# EasyEDA Pro project bliysfyt-night-light-af2cf507.epro, board PCB1
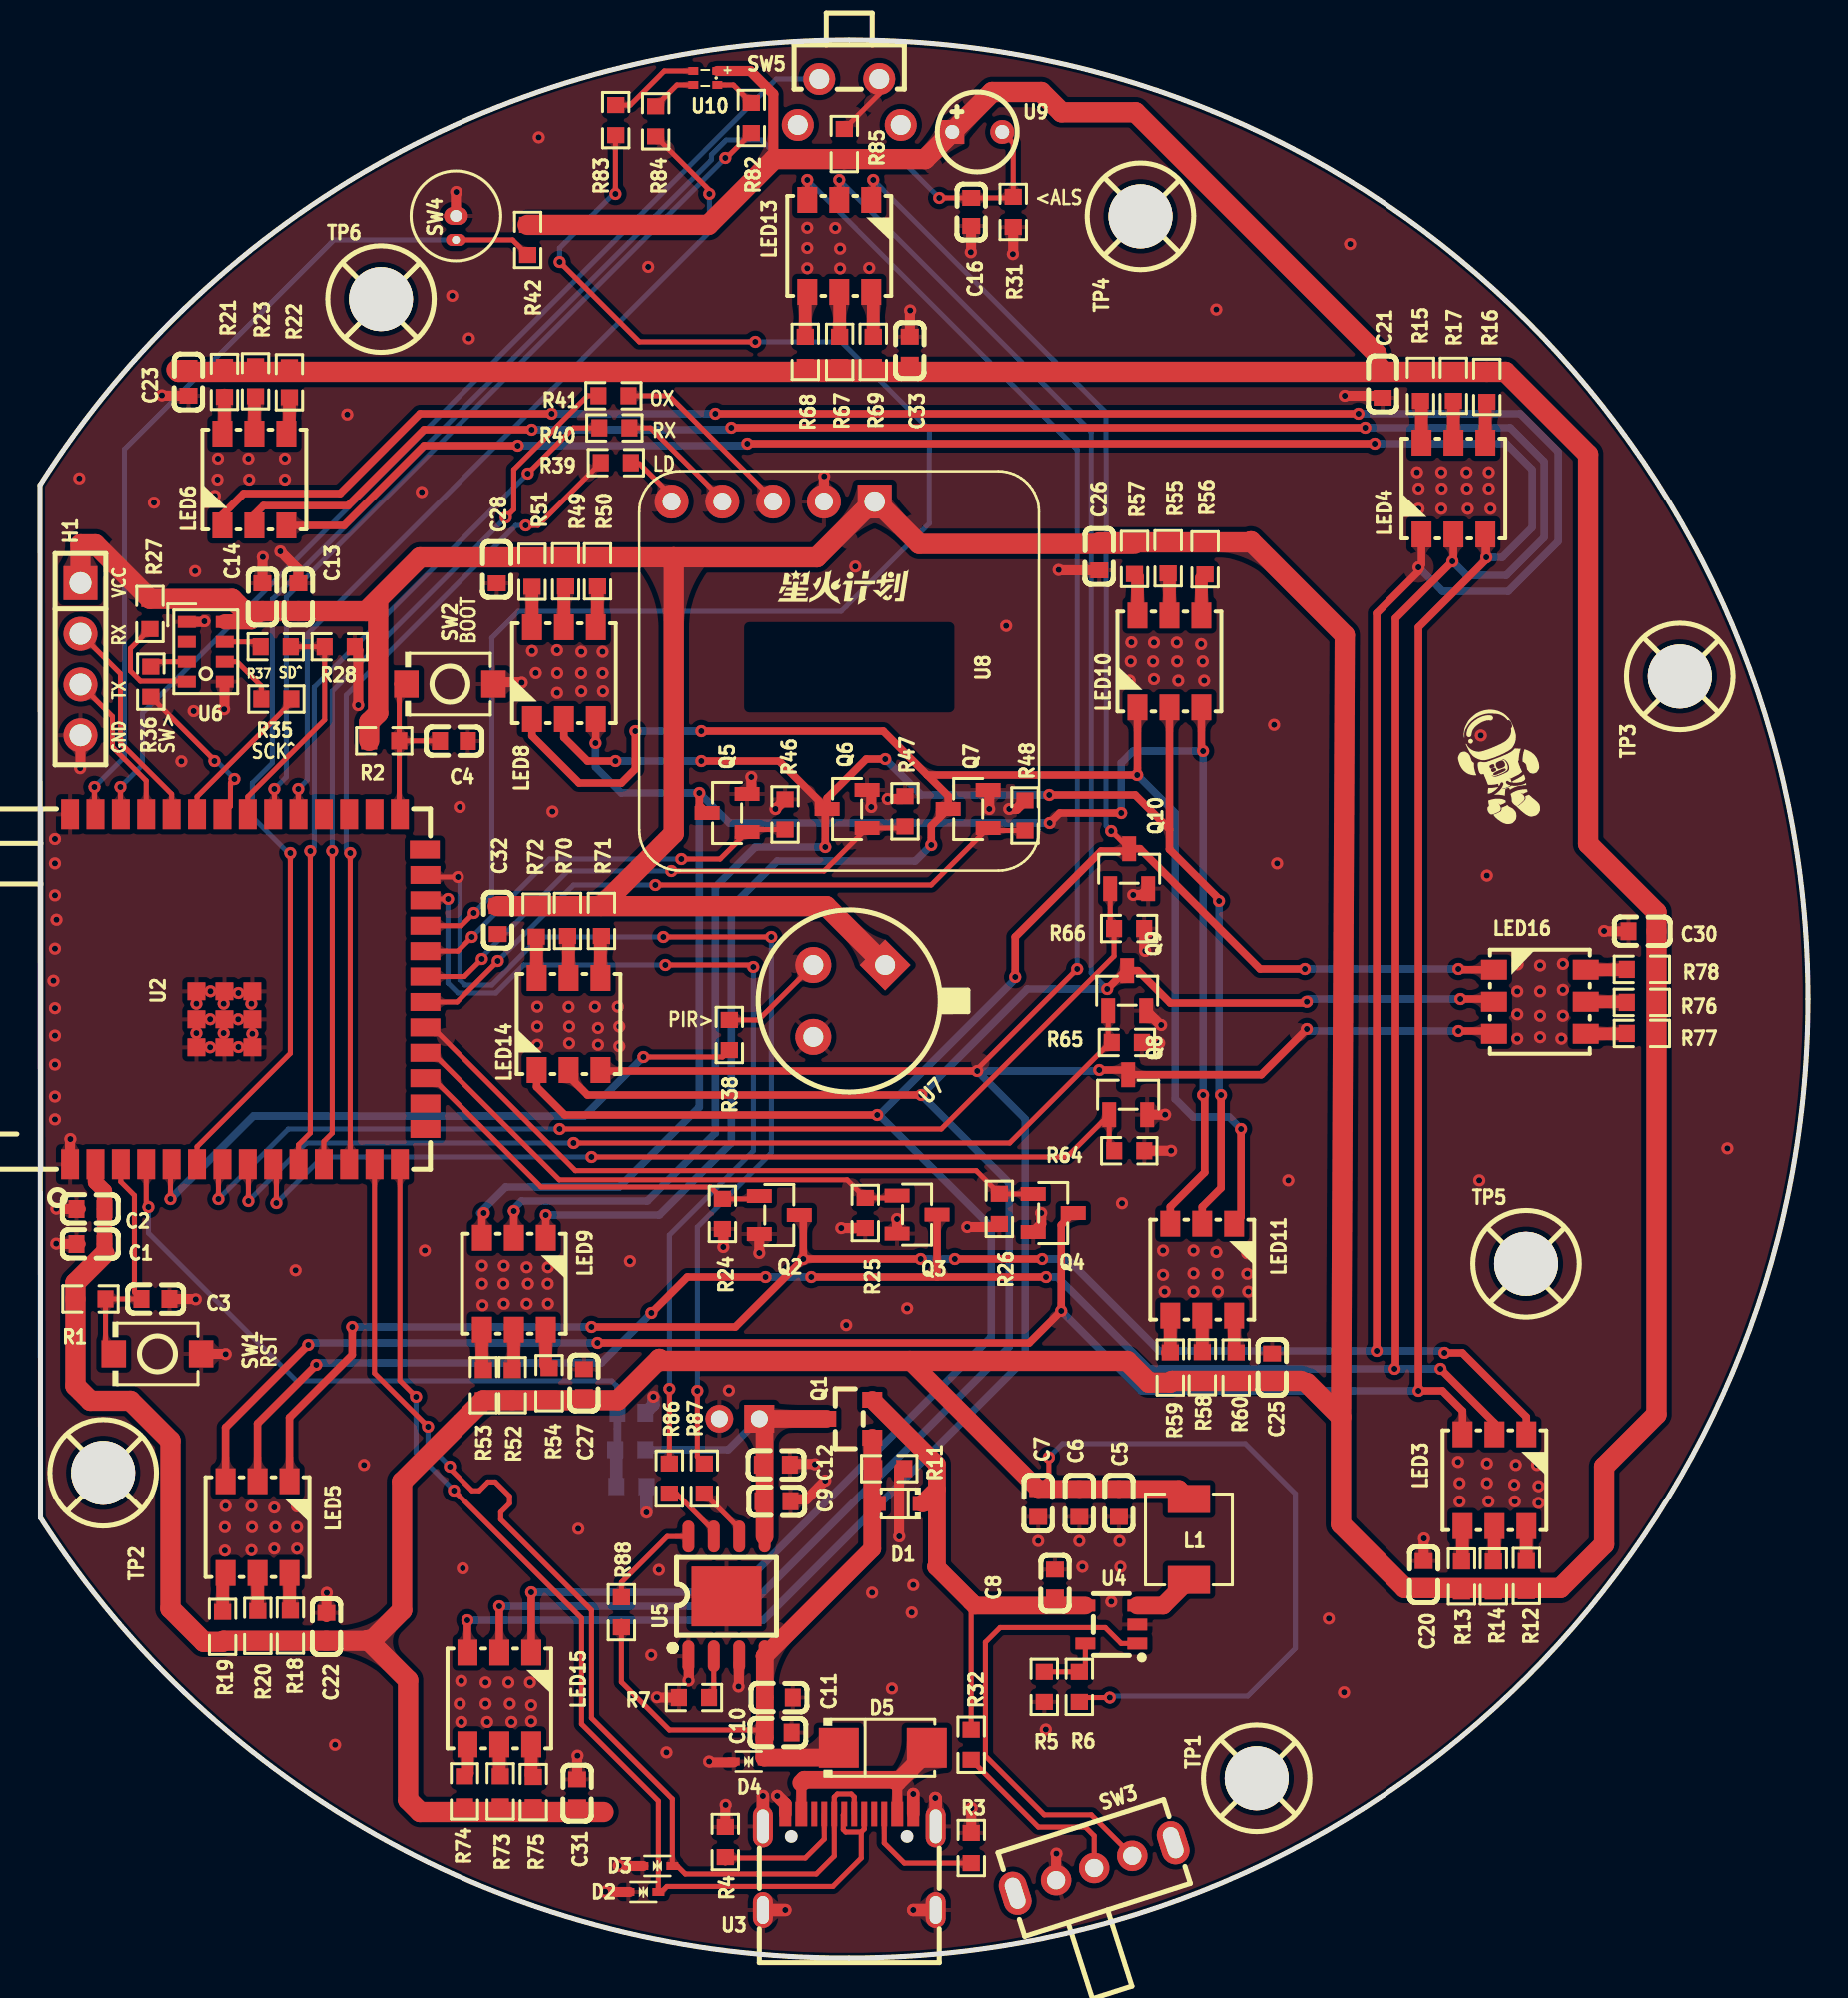
[diagram p3: board, top side]
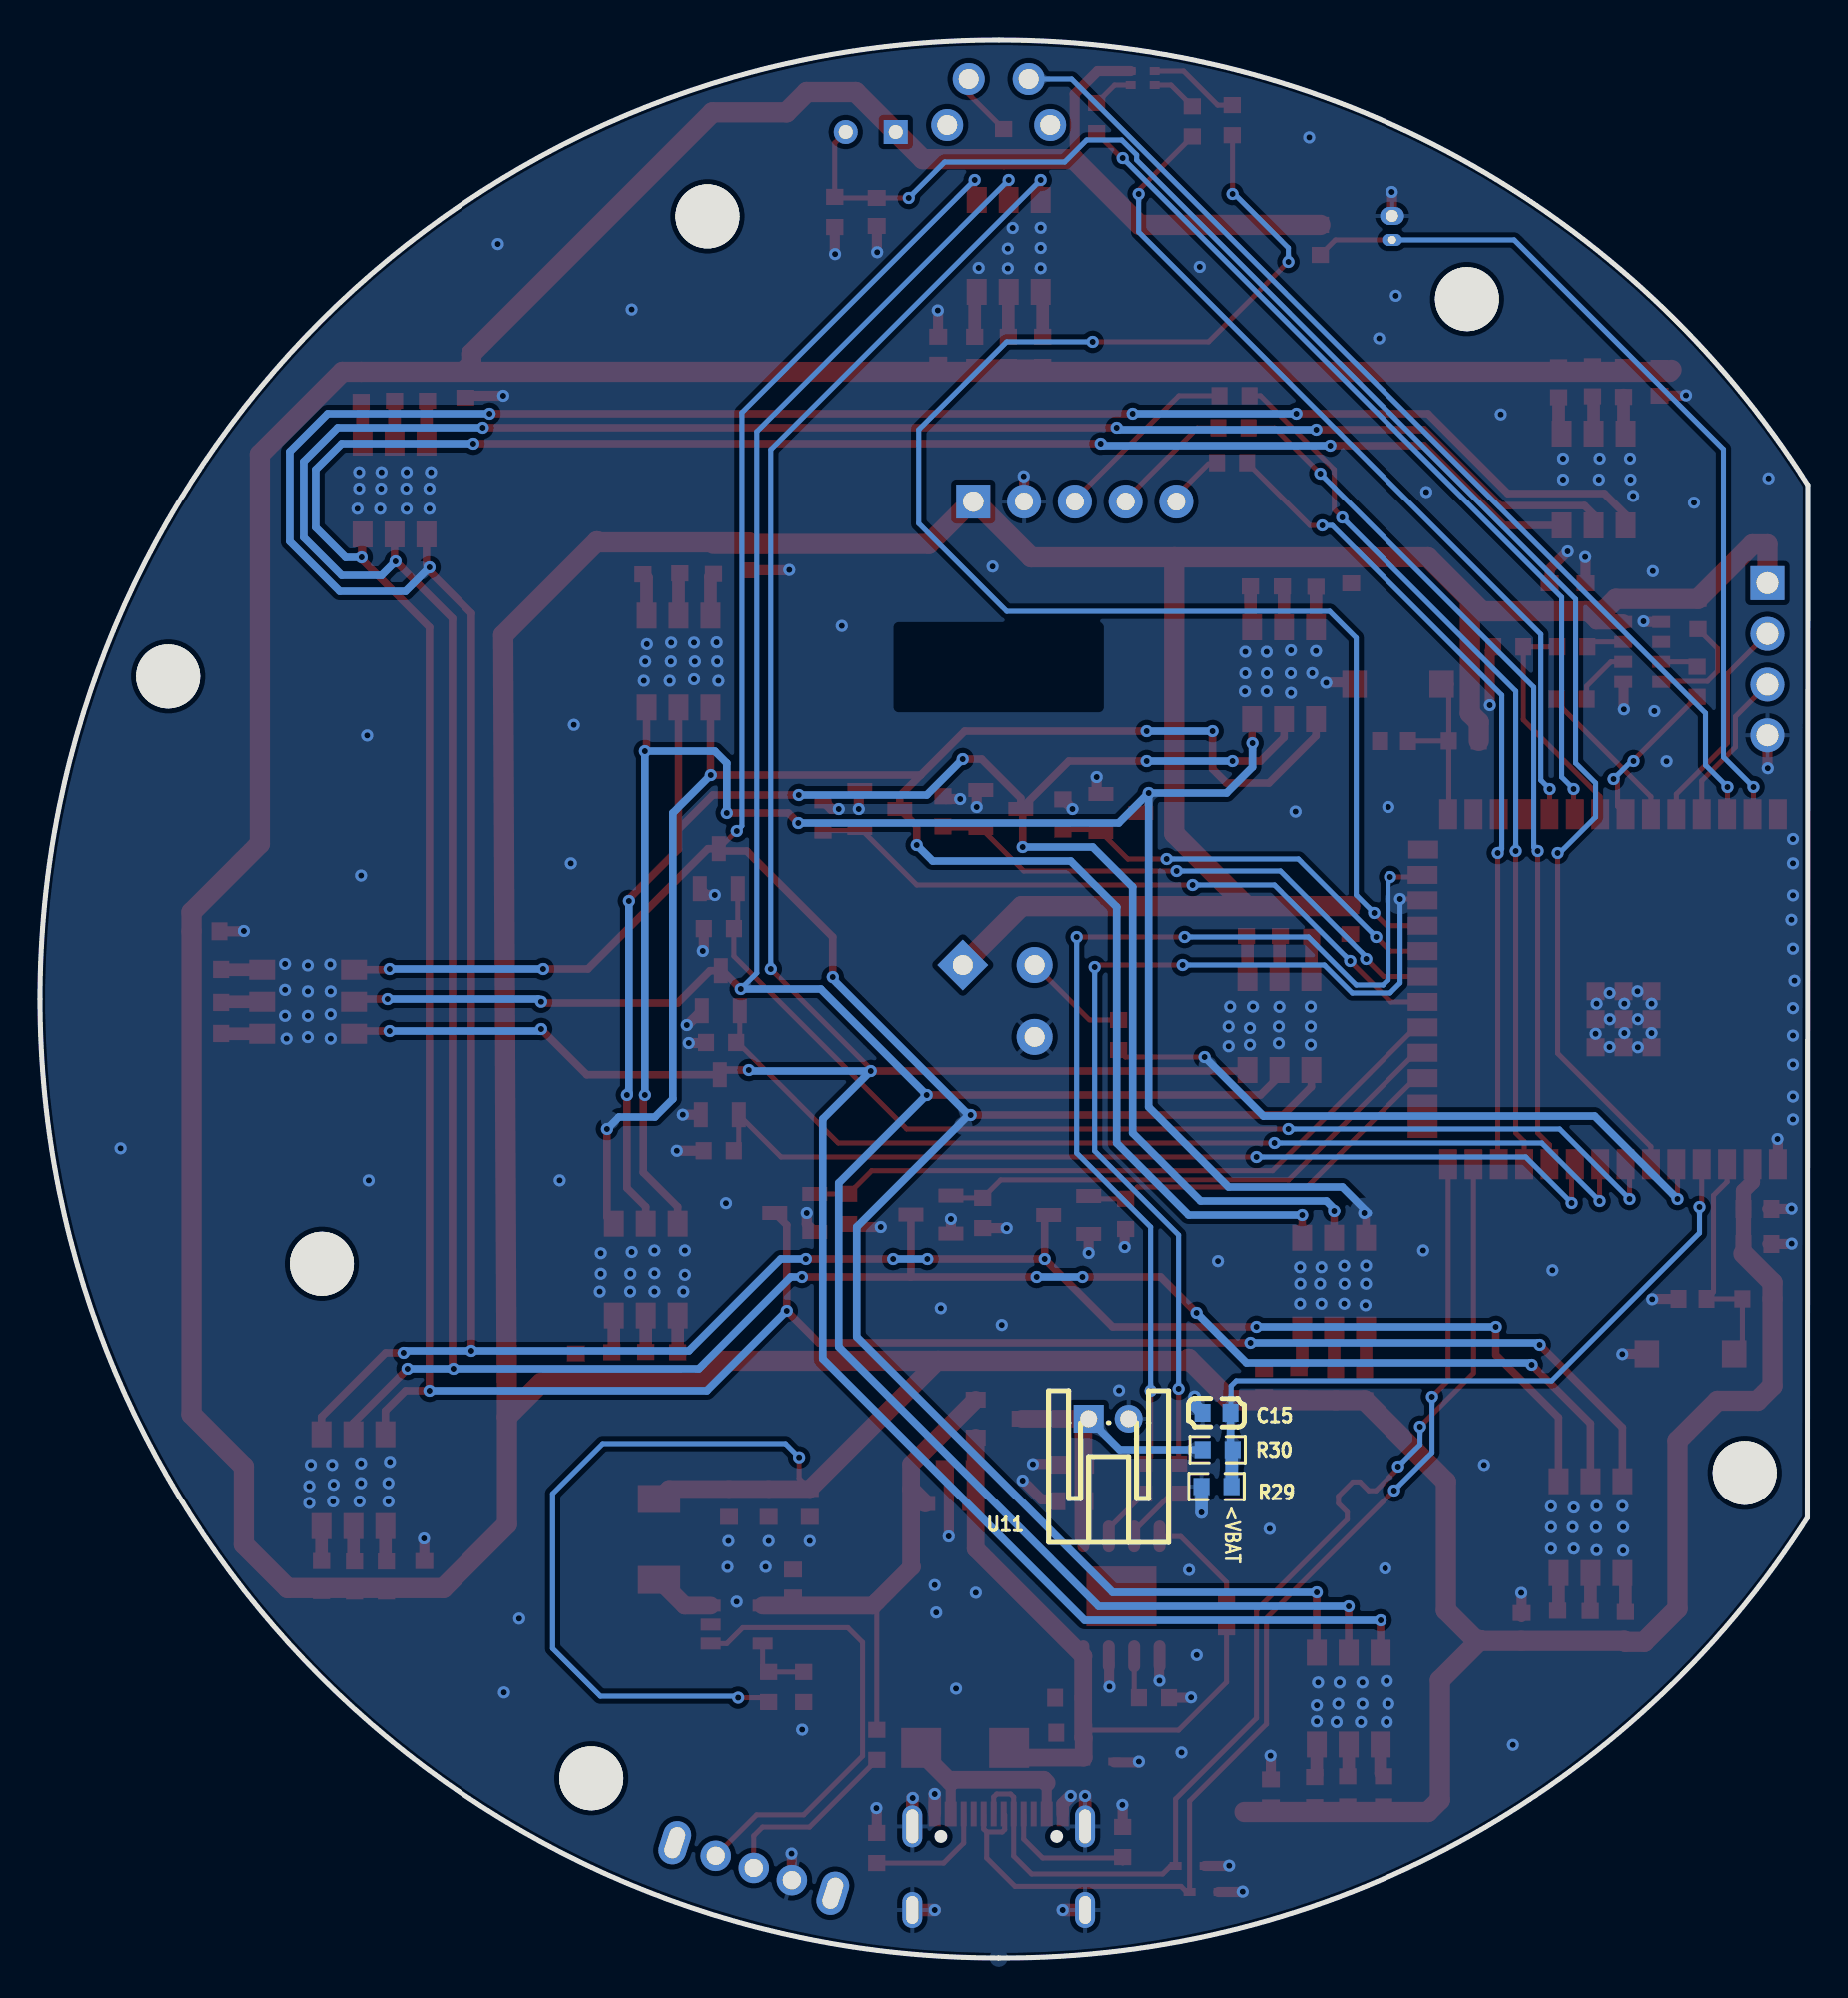
[diagram p4: board, bottom side, seen from below]

Outline 88.53 x 96 mm; copper layers: Top Layer, Bottom Layer. Coordinates in mm from the lower left corner of the outline.
Outline path: 0,73.72 0.03,22.03 arc(17.44,5.81) 40.53,0 arc(74.47,14.06) 88.53,48 arc(74.47,81.94) 40.53,96 arc(17.4,90.06) 0,73.72
Stack: Top Layer 0.035mm / Dielectric1 1.51mm FR4 er 4.5 / Bottom Layer 0.035mm

## Design rules (mm)
net IO19: DP1
net IO20: DP1
spacing copperThickness1oz (default): track to track 0.102, other pairs 0.152 to 0.3
spacing copperThickness2oz: track to track 0.203, other pairs 0.152 to 0.3
spacing Plane_innerPlane: track to track 0.102, other pairs 0.152 to 0.3
spacing Copper_copperRegion: track to track 0.102, other pairs 0.152 to 0.3
track width copperThickness1oz (default): min 0.127, default 0.254, max 2.54
track width copperThickness2oz: min 0.203, default 0.254, max 2.54
differential pair differentialPair (default): width min 0.127, default 0.254, max 2.54; gap min 0.152, default 0.152
pour e1340 uses Copper_copperRegion
pour e1384 uses Copper_copperRegion

## Placement (name value [footprint] x y rotation side)
C1  22uF  [C0603]  2.53 35.75 0 top
C2  100nF  [C0603]  2.53 37.5 0 top
C3  1uF  [C0603]  5.78 33 180 top
C4  1uF  [C0603]  20.73 60.9 180 top
C5  10uF  [C0603]  54.01 22.78 90 top
C6  10uF  [C0603]  52.03 22.78 90 top
C7  10uF  [C0603]  49.98 22.78 90 top
C8  4.7uF  [C0603]  50.81 18.74 270 top
C9  10uF  [C0603]  36.89 22.86 180 top
C10  10uF  [C0603]  36.94 11.27 180 top
C11  100nF  [C0603]  37 13.02 180 top
C12  100nF  [C0603]  36.85 24.7 180 top
C13  10uF  [C0603]  12.93 68.1 270 top
C14  100nF  [C0603]  11.13 68.1 270 top
C15  100nF  [C0603]  29.63 27.3 180 bottom
C16  100nF  [C0603]  46.63 87.4 90 top
C20  100nF  [C0603]  69.28 19.17 270 top
C21  100nF  [C0603]  67.23 78.8 90 top
C22  100nF  [C0603]  14.33 16.57 270 top
C23  100nF  [C0603]  7.43 78.9 90 top
C25  100nF  [C0603]  61.68 29.57 270 top
C26  100nF  [C0603]  53.03 70.15 90 top
C27  100nF  [C0603]  27.25 28.78 270 top
C28  100nF  [C0603]  22.88 69.5 90 top
C30  100nF  [C0603]  80.25 51.38 0 top
C31  100nF  [C0603]  26.9 8.23 270 top
C32  100nF  [C0603]  22.93 51.94 90 top
C33  100nF  [C0603]  43.55 80.46 270 top
D1  1N5819WS  [SOD-323_L1.8-W1.3-LS2.5-RD]  43.03 22.75 180 top
D2  LESD5D5.0CT1G  [SOD-523_L1.2-W0.8-LS1.6-BI]  30.23 3.3 0 top
D3  LESD5D5.0CT1G  [SOD-523_L1.2-W0.8-LS1.6-BI]  30.93 4.6 180 top
D4  LESD5D5.0CT1G  [SOD-523_L1.2-W0.8-LS1.6-BI]  35.5 9.82 0 top
D5  SS34  [SMA_L4.3-W2.6-LS5.2-RD]  42.2 10.51 0 top
H1  PM254V-11-04-H85  [HDR-TH_4P-P2.54-V-F]  2.03 65 270 top
L1  2.2uH  [IND-SMD_L4.4-W4.2]  57.52 20.95 270 top
LED3  S6-5050RGBTA  [LED-SMD_6P-L5.0-W5.0-P1.60-LS5.4-TL]  72.83 23.92 270 top
LED4  S6-5050RGBTA  [LED-SMD_6P-L5.0-W5.0-P1.60-LS5.4-TL]  70.78 73.55 90 top
LED5  S6-5050RGBTA  [LED-SMD_6P-L5.0-W5.0-P1.60-LS5.4-TL]  10.88 21.57 270 top
LED6  S6-5050RGBTA  [LED-SMD_6P-L5.0-W5.0-P1.60-LS5.4-TL]  10.73 74 90 top
LED8  S6-5050RGBTA  [LED-SMD_6P-L5.0-W5.0-P1.60-LS5.4-TL]  26.24 64.3 90 top
LED9  S6-5050RGBTA  [LED-SMD_6P-L5.0-W5.0-P1.60-LS5.4-TL]  23.73 33.76 270 top
LED10  S6-5050RGBTA  [LED-SMD_6P-L5.0-W5.0-P1.60-LS5.4-TL]  56.54 64.89 90 top
LED11  S6-5050RGBTA  [LED-SMD_6P-L5.0-W5.0-P1.60-LS5.4-TL]  58.18 34.47 270 top
LED13  S6-5050RGBTA  [LED-SMD_6P-L5.0-W5.0-P1.60-LS5.4-TL]  40.03 85.7 270 top
LED14  S6-5050RGBTA  [LED-SMD_6P-L5.0-W5.0-P1.60-LS5.4-TL]  26.48 46.75 90 top
LED15  S6-5050RGBTA  [LED-SMD_6P-L5.0-W5.0-P1.60-LS5.4-TL]  23 12.98 270 top
LED16  S6-5050RGBTA  [LED-SMD_6P-L5.0-W5.0-P1.60-LS5.4-TL]  75.11 47.86 0 top
Q1  AO3401A  [SOT-23_L2.9-W1.3-P1.90-LS2.4-BR]  40.53 27 0 top
Q2  SI2302-HXY  [SOT-23-3_L2.9-W1.3-P1.90-LS2.4-BR]  37.03 37.2 180 top
Q3  SI2302-HXY  [SOT-23-3_L2.9-W1.3-P1.90-LS2.4-BR]  43.92 37.22 180 top
Q4  SI2302-HXY  [SOT-23-3_L2.9-W1.3-P1.90-LS2.4-BR]  50.73 37.3 180 top
Q5  SI2302-HXY  [SOT-23-3_L2.9-W1.3-P1.90-LS2.4-BR]  34.41 57.3 0 top
Q6  SI2302-HXY  [SOT-23-3_L2.9-W1.3-P1.90-LS2.4-BR]  40.42 57.5 0 top
Q7  SI2302-HXY  [SOT-23-3_L2.9-W1.3-P1.90-LS2.4-BR]  46.47 57.5 0 top
Q8  SI2302-HXY  [SOT-23-3_L2.9-W1.3-P1.90-LS2.4-BR]  54.48 43.22 270 top
Q9  SI2302-HXY  [SOT-23-3_L2.9-W1.3-P1.90-LS2.4-BR]  54.43 48.42 270 top
Q10  SI2302-HXY  [SOT-23-3_L2.9-W1.3-P1.90-LS2.4-BR]  54.53 54.52 270 top
R1  10kΩ  [R0603]  2.53 33 180 top
R2  10kΩ  [R0603]  17.23 60.91 180 top
R3  5.1kΩ  [R0603]  46.63 5.5 270 top
R4  5.1kΩ  [R0603]  34.33 5.8 90 top
R5  100kΩ  [R0603]  50.28 13.56 90 top
R6  442kΩ  [R0603]  52.03 13.56 90 top
R7  1.6kΩ  [R0603]  32.76 13.02 0 top
R11  10kΩ  [R0603]  42.53 24.5 180 top
R12  15Ω  [R0603]  74.43 19.12 270 top
R13  15Ω  [R0603]  71.18 19.09 270 top
R14  68Ω  [R0603]  72.78 19.09 270 top
R15  15Ω  [R0603]  69.13 78.7 90 top
R16  15Ω  [R0603]  72.45 78.65 90 top
R17  68Ω  [R0603]  70.78 78.7 90 top
R18  15Ω  [R0603]  12.53 16.63 270 top
R19  15Ω  [R0603]  9.13 16.57 270 top
R20  68Ω  [R0603]  10.9 16.62 270 top
R21  15Ω  [R0603]  9.23 78.89 90 top
R22  15Ω  [R0603]  12.48 78.87 90 top
R23  68Ω  [R0603]  10.78 78.92 90 top
R24  10kΩ  [R0603]  34.18 37.25 90 top
R25  10kΩ  [R0603]  41.33 37.3 90 top
R26  10kΩ  [R0603]  48.03 37.51 90 top
R27  10kΩ  [R0603]  5.5 67.26 90 top
R28  100kΩ  [R0603]  15 65.62 180 top
R29  10kΩ  [R0603]  29.57 25.45 0 bottom
R30  10kΩ  [R0603]  29.63 23.6 180 bottom
R31  2kΩ  [R0603]  48.73 87.4 90 top
R32  10kΩ  [R0603]  46.62 10.66 270 top
R35  0Ω  [R0603]  11.83 63 0 top
R36  0Ω  [R0603]  5.55 63.87 270 top
R37  0Ω  [R0603]  11.79 65.62 0 top
R38  0Ω  [R0603]  34.53 46.2 90 top
R39  0Ω  [R0603]  28.85 74.85 180 top
R40  0Ω  [R0603]  28.77 76.59 180 top
R41  0Ω  [R0603]  28.73 78.2 180 top
R42  10kΩ  [R0603]  24.43 86 90 top
R46  10kΩ  [R0603]  37.31 57.23 270 top
R47  10kΩ  [R0603]  43.31 57.38 270 top
R48  10kΩ  [R0603]  49.31 57.18 270 top
R49  68Ω  [R0603]  26.33 69.4 90 top
R50  15Ω  [R0603]  27.93 69.4 90 top
R51  15Ω  [R0603]  24.64 69.38 90 top
R52  68Ω  [R0603]  23.65 28.68 270 top
R53  15Ω  [R0603]  22.21 28.68 270 top
R54  15Ω  [R0603]  25.5 28.78 270 top
R55  68Ω  [R0603]  56.48 70.05 90 top
R56  15Ω  [R0603]  58.33 70 90 top
R57  15Ω  [R0603]  54.79 70.02 90 top
R58  68Ω  [R0603]  58.19 29.58 270 top
R59  15Ω  [R0603]  56.58 29.57 270 top
R60  15Ω  [R0603]  59.88 29.57 270 top
R64  10kΩ  [R0603]  54.53 40.41 180 top
R65  10kΩ  [R0603]  54.41 45.83 180 top
R66  10kΩ  [R0603]  54.52 51.52 180 top
R67  68Ω  [R0603]  40.05 80.4 270 top
R68  15Ω  [R0603]  38.33 80.4 270 top
R69  15Ω  [R0603]  41.73 80.4 270 top
R70  68Ω  [R0603]  26.43 51.9 90 top
R71  15Ω  [R0603]  28.13 51.9 90 top
R72  15Ω  [R0603]  24.86 51.86 90 top
R73  68Ω  [R0603]  23.05 8.33 270 top
R74  15Ω  [R0603]  21.25 8.33 270 top
R75  15Ω  [R0603]  24.71 8.29 270 top
R76  68Ω  [R0603]  80.22 47.83 0 top
R77  15Ω  [R0603]  80.22 46.28 0 top
R78  15Ω  [R0603]  80.22 49.48 0 top
R82  68Ω  [R0603]  35.63 92.1 90 top
R83  15Ω  [R0603]  28.84 91.99 270 top
R84  15Ω  [R0603]  30.84 91.93 270 top
R85  10kΩ  [R0603]  40.28 90.8 270 top
R86  0Ω  [R0603]  31.53 24 270 top
R87  0Ω  [R0603]  33.28 24 270 top
R88  10kΩ  [R0603]  29.13 17.3 270 top
SW1  TS-1088R-02026  [SW-SMD_L3.9-W3.0-P4.45]  5.88 30.25 180 top
SW2  TS-1088R-02026  [SW-SMD_L3.9-W3.0-P4.45]  20.53 63.75 180 top
SW3  SK12D07VG4  [SW-TH_SK12D07VG4]  52.78 4.5 17.7 top
SW4  SW-18010P  [SW-TH_SW-18010P]  20.83 86.6 90 top
SW5  GT-TA092B-H038-L1  [SW-TH_GT-TA092B-H038-L1]  40.53 92.9 0 top
TP1  -  [M3螺丝]  60.98 9.05 90 top
TP2  -  [M3螺丝]  3.23 24.35 90 top
TP3  -  [M3螺丝]  82.18 64.2 90 top
TP4  -  [M3螺丝]  55.16 87.24 90 top
TP5  -  [M3螺丝]  74.48 34.7 0 top
TP6  -  [M3螺丝]  17.13 82.98 0 top
U2  ESP32-S3-WROOM-1-N16R2  [wirelm-smd_esp32-s3-wroom-1]  10.4 48.49 90 top
U3  GT-USB-7010ASV  [USB-C-SMD_G-SWITCH_GT-USB-7010ASV]  40.53 4.8 0 top
U4  TLV62569DBVR  [SOT-23-5_L3.0-W1.7-P0.95-LS2.8-BR]  53.63 16.68 0 top
U5  TP4056X-42-ESOP8  [SOP-8_L4.9-W3.9-P1.27-LS6.0-TL-EP]  34.39 18.09 90 top
U6  MSM261S4030H0R  [LGA-8_L4.0-W3.0-P1.00-BL]  8.29 65.37 270 top
U7  PIR223D-S0  [TO-5-3_BD9.1-P2.54-L]  39.63 48.8 225 top
U8  -  [hlk-ld2410s/2420封装]  40.53 64.3 90 top
U9  ALS-PDIC144-6C/L378  [SENSORM-TH_EVERLIGHT_ALS-PDIC144-6C--L378]  46.93 91.4 0 top
U10  XL-1608RGBC  [LED-SMD_4P-L1.6-W0.8-BL]  33.33 94.1 180 top
U11  S2B-PH-K-S(LF)(SN)  [CONN-TH_S2B-PH-K-S-LF-SN]  35.03 27 0 bottom

## Footprints (pads in the part's own frame, mm; a bottom-side part is the same pattern mirrored in y, then rotated)
C0603
  rect 0.8x0.9 smd: 1(-0.7,0) 2(0.7,0)
CONN-TH_S2B-PH-K-S-LF-SN
  rect 1.5x1.4 hole 0.85: 1(1,0)
  round 1.4 hole 0.85: 2(-1,0)
HDR-TH_4P-P2.54-V-F
  rect 1.7x1.7 hole 1.1: 1(-3.81,0)
  round 1.7 hole 1.1: 2(-1.27,0) 3(1.27,0) 4(3.81,0)
hlk-ld2410s/2420封装
  rect 1.7x1.7 hole 1.02: 1(8.596,-1.271)
  round 1.7 hole 0.9: 2(8.596,1.269) 3(8.596,3.809) 4(8.596,6.349) 5(8.596,8.889)
IND-SMD_L4.4-W4.2
  rect 1.4x2.12 smd: 1(2.028,0) 2(-2.028,0)
LED-SMD_4P-L1.6-W0.8-BL
  rect 0.5x0.4 smd: 1(-0.6,0.35) 2(0.6,0.35) 3(-0.6,-0.35) 4(0.6,-0.35)
LED-SMD_6P-L5.0-W5.0-P1.60-LS5.4-TL
  rect 1.3x1 smd: 1(-2.3,1.6) 2(2.3,1.6) 3(-2.3,0) 4(2.3,0) 5(-2.3,-1.6) 6(2.3,-1.6)
LGA-8_L4.0-W3.0-P1.00-BL
  rect 0.6x0.9 smd: 1(-1.5,-0.95) 2(-0.5,-0.95) 3(0.5,-0.95) 4(1.5,-0.95) 5(1.5,0.95) 6(0.5,0.95) 7(-0.5,0.95) 8(-1.5,0.95)
M3螺丝
  round 3.2 hole 3.2: 1(-0.064,0.064)
R0603
  rect 0.806x0.864 smd: 1(-0.753,0) 2(0.753,0)
SENSORM-TH_EVERLIGHT_ALS-PDIC144-6C--L378
  rect 1.2x1.2 hole 0.7: 1(-1.25,0)
  round 1.2 hole 0.7: 2(1.25,0)
SMA_L4.3-W2.6-LS5.2-RD
  rect 2x2 smd: 1(-2.2,0) 2(2.2,0)
SOD-323_L1.8-W1.3-LS2.5-RD
  rect 1x0.75 smd: 1(-1.173,0) 2(1.173,0)
SOD-523_L1.2-W0.8-LS1.6-BI
  rect 0.6x0.4 smd: 1(-0.75,0) 2(0.75,0)
SOP-8_L4.9-W3.9-P1.27-LS6.0-TL-EP
  oval 1.6x0.6 smd: 1(-3,1.905) 2(-3,0.635) 3(-3,-0.635) 4(-3,-1.905) 5(3,-1.905) 6(3,-0.635) 7(3,0.635) 8(3,1.905)
  rect 3x3.5 smd: 9(0,0)
SOT-23-3_L2.9-W1.3-P1.90-LS2.4-BR
  rect 1.25x0.7 smd: 1(1,-0.95) 2(1,0.95) 3(-1,0)
SOT-23-5_L3.0-W1.7-P0.95-LS2.8-BR
  rect 1x0.6 smd: 1(1.3,-0.95) 2(1.3,0) 3(1.3,0.95) 4(-1.3,0.95) 5(-1.3,-0.95)
SOT-23_L2.9-W1.3-P1.90-LS2.4-BR
  rect 1x0.8 smd: 1(1.15,-0.95) 2(1.15,0.95) 3(-1.15,0)
SW-SMD_L3.9-W3.0-P4.45
  rect 1.23x1.36 smd: 1(-2.185,0) 2(2.185,0)
SW-TH_GT-TA092B-H038-L1
  round 1.6 hole 1: 1(-1.5,1.15) 2(1.5,1.15) 3(-2.575,-1.15) 4(2.575,-1.15)
SW-TH_SK12D07VG4
  round 1.524 hole 0.914: 1(-2,0) 2(0,0) 3(2,0)
  oval 1.4x2.2 hole 0.8x1.6: 4(4.15,0) 5(-4.15,0)
SW-TH_SW-18010P
  oval 0.9x1.2 hole 0.6: 1(0.6,0)
  oval 0.6x1 hole 0.4: 2(-0.6,0)
TO-5-3_BD9.1-P2.54-L
  rect 1.8x1.8 hole 1: 1(-2.54,1.27)
  round 1.8 hole 1: 2(0,-1.27) 3(2.54,1.27)
USB-C-SMD_G-SWITCH_GT-USB-7010ASV
  oval 1x2.1 hole 0.6x1.7: 1(-4.32,1.78) 2(4.32,1.78)
  oval 1x1.8 hole 0.6x1.4: 3(4.32,-2.4) 4(-4.32,-2.4)
  rect 0.6x1.24 smd: A1B12(-3.2,2.4) A4B9(-2.4,2.4) B1A12(3.2,2.4) B4A9(2.4,2.4)
  rect 0.3x1.24 smd: A5(-1.25,2.4) A6(-0.25,2.4) A7(0.25,2.4) A8(1.25,2.4) B5(1.75,2.4) B6(0.75,2.4) B7(-0.75,2.4) B8(-1.75,2.4)
wirelm-smd_esp32-s3-wroom-1
  rect 1.5x0.9 smd: 1(-8.75,8.895) 2(-8.75,7.625) 3(-8.75,6.355) 4(-8.75,5.085) 5(-8.75,3.815) 6(-8.75,2.545) 7(-8.75,1.275) 8(-8.75,0.005) 9(-8.75,-1.265) 10(-8.75,-2.535) 11(-8.75,-3.805) 12(-8.75,-5.075) 13(-8.75,-6.345) 14(-8.75,-7.615) 27(8.75,-7.615) 28(8.75,-6.345) 29(8.75,-5.075) 30(8.75,-3.805) 31(8.75,-2.535) 32(8.75,-1.265) 33(8.75,0.005) 34(8.75,1.275) 35(8.75,2.545) 36(8.75,3.815) 37(8.75,5.085) 38(8.75,6.355) 39(8.75,7.625) 40(8.75,8.895)
  rect 0.9x1.5 smd: 15(-6.985,-8.895) 16(-5.715,-8.895) 17(-4.445,-8.895) 18(-3.175,-8.895) 19(-1.905,-8.895) 20(-0.635,-8.895) 21(0.635,-8.895) 22(1.905,-8.895) 23(3.175,-8.895) 24(4.445,-8.895) 25(5.715,-8.895) 26(6.985,-8.865)
  rect 0.9x0.9 smd: 41(-2.9,2.575) 41(-2.9,1.175) 41(-2.9,-0.225) 41(-1.5,2.575) 41(-1.5,1.175) 41(-1.5,-0.225) 41(-0.1,2.575) 41(-0.1,1.175) 41(-0.1,-0.225)

## Nets
As in the schematic.

Pads without a net: SW3 4 5; SW5 3 4; TP1 1; TP2 1; TP3 1; TP4 1; TP5 1; TP6 1; U2 15 16 26 28 29 30; U3 A8 B8; U6 2

## Via types
v1: diameter 0.61, hole 0.305, Top Layer to Bottom Layer, 390 vias

## Routing (per net, layer and track width the routed paths; a pad name or vN(x,y) marks a point on that pad's centre or on a via; arc(x,y) is an arc through that point)
GND: length 78.2
  Top Layer w0.254: U2.41 9.05,46.99
  Top Layer w0.508: v1(48.53,57.5) 48.89,57.5 R48.1 ; C26.1 53.02,69.45 51.02,69.45 v1(51,69.47) ; v1(46.64,7.5) 46.63,7.48 46.63,6.28 ; v1(32.49,13.88) 32.5,13.89 32.5,15.1 ; 32.12,13.02 30.92,13.02 v1(30.9,13.04) ; 48.73,86.51 48.73,85.31 v1(48.71,85.29) ; v1(65.33,78.2) 66.74,78.2 ; v1(47.53,57.5) 47.53,58.4 Q7.2 ; 1.51,39.78 1.51,40.98 v1(1.52,41) ; v1(43.57,82.47) 43.56,82.46 43.56,81.25 ; v1(55.33,50.4) 55.28,50.45 R66.1 ; v1(56.13,46.7) 56.09,46.7 Q9.2 ; v1(34.23,35.6) 34.23,36.45 R24.1 ; v1(34.34,7.66) 34.33,7.64 34.33,6.44 ; v1(9.21,62.49) 9.23,62.51 9.23,63.71 ; v1(12.03,70.4) 12.93,69.5 C13.1 ; v1(78.33,51.4) 78.34,51.38 C30.1 ; 6.57,33 7.78,33 v1(7.79,32.98) ; 7.32,78.2 6.12,78.2 v1(6.1,78.22) ; 30.22,4.6 29.01,4.6 v1(29,4.62) ; Q3.2 v1(42.92,37) ; 33.53,9.8 33.55,9.78 34.75,9.78 ; R25.1 v1(40.13,36.55) ; v1(0.81,35.77) 0.83,35.75 2.03,35.75 ; v1(20.84,88.4) 20.83,88.38 20.83,87.18 ; 48.03,36.75 47.88,36.6 v1(46.43,36.6) ; v1(0.82,37.52) 0.84,37.5 2.04,37.5 ; v1(26.92,10.12) 26.91,10.1 26.91,8.9 ; v1(35.63,59.1) 35.63,58.46 Q5.2 ; 42.73,58 43.18,58 R47.1 ; 22.91,63.84 24.11,63.84 v1(24.13,63.83) ; v1(46.6,85.38) 46.62,85.4 46.62,86.6 ; Q6.2 41.63,58.24 v1(41.63,57.6) ; v1(2.01,59.54) 2.03,59.56 2.03,60.76 ; v1(11.15,70.12) 11.13,70.1 11.13,68.9 ; Q8.2 v1(56.33,42.22) ; v1(14.35,18.27) 14.34,18.26 14.34,17.05 ; v1(54.73,53.2) 55.16,53.2 Q10.2 ; 37.6,22.96 38.38,22.96 v1(39.33,23.9) ; v1(43.03,21.1) 43.02,21.11 43.02,24.54 ; Q2.2 v1(36.03,35.3) ; Q4.2 50.13,36.75 v1(50.13,37.3) ; 36.83,57.5 v1(36.84,57.5) R46.1 ; v1(28.32,3.32) 28.33,3.3 29.54,3.3 ; 37.6,24.73 38.8,24.73 v1(38.82,24.72) ; 39.26,72.94 39.26,74.15 v1(39.27,74.16) ; 50.87,4 50.87,5.2 v1(50.89,5.22) ; 8.07,30.25 9.27,30.25 v1(9.29,30.23) ; 35,14.8 35,13.59 v1(34.99,13.58) ; 69.28,19.78 69.28,20.98 v1(69.3,21) ; R64.1 v1(56.63,40.41) ; R28.1 15.93,65.44 v1(15.93,62.7) ; v1(56.03,45.8) 55.19,45.8 R65.1 ; v1(8.23,66.9) 8.19,66.87 7.18,66.87
  Top Layer w0.635: v1(43.73,8.2) U3.B1A12 ; U3.3 v1(43.73,2.4) ; v1(36.93,8.1) 37.33,7.7 U3.A1B12 ; v1(44.83,8) 44.85,7.98 U3.2 ; U3.4 v1(37.33,2.4) ; U3.1 v1(36.21,8.1)
  Bottom Layer w0.635: R30.1 v1(30.38,22.3) ; v1(30.73,28.1) 30.73,27.7 C15.1
  vias: v1(0.67,48.91) v1(0.75,56) v1(0.75,54.78) v1(0.75,53.18) v1(0.75,50.51) v1(0.75,47.54) v1(0.75,46.17) v1(0.75,44.72) v1(0.75,43.12) v1(0.75,41.98) v1(0.83,51.96) v1(1.97,74.06) v1(5.7,72.84) v1(7.07,59.89) v1(7.76,69.41) v1(7.68,62.4) v1(7.83,47.77) v1(7.83,46.3) v1(8.53,48.39) v1(8.51,46.99) v1(8.51,45.59) v1(8.75,73.18) v1(8.9,75.05) v1(8.88,74) v1(9.19,47.77) v1(9.19,46.3) v1(9.25,21.57) v1(9.25,20.39) v1(9.28,22.63) v1(9.93,48.3) v1(9.92,46.99) v1(9.93,45.6) v1(10.43,75.05) v1(10.46,74) v1(10.58,47.77) v1(10.63,46.26) v1(10.58,22.63) v1(10.61,21.57) v1(10.58,20.42) v1(11.72,22.55) v1(11.72,20.49) v1(11.78,21.57) v1(12.26,75.05) v1(12.26,74) v1(12.79,34.44) v1(12.86,22.61) v1(12.86,21.57) v1(12.87,20.49) v1(14.77,10.66) v1(15.38,77.26) v1(16.22,24.68) v1(19.11,73.37) v1(19.27,35.43) v1(20.64,83.2) v1(21.02,57.6) v1(21.02,12.72) v1(21.17,19.5) v1(21.1,13.86) v1(21.1,11.81) v1(21.48,81.07) v1(22.13,34.67) v1(22.14,33.76) v1(22.16,32.68) v1(22.31,13.79) v1(22.31,12.72) v1(22.39,11.81) v1(23.23,34.67) v1(23.21,33.76) v1(23.23,32.76) v1(23.46,13.79) v1(23.53,12.72) v1(23.61,11.81) v1(24.37,34.59) v1(24.37,32.76) v1(24.44,33.76) v1(24.54,13.79) v1(24.64,65.41) v1(24.6,12.64) v1(24.6,11.84) v1(24.83,64.31) v1(24.91,47.62) v1(24.91,46.63) v1(24.91,45.71) v1(24.98,91.13) v1(25.44,34.59) v1(25.43,33.76) v1(25.44,32.76) v1(25.67,57.37) v1(25.9,65.45) v1(25.9,64.3) v1(25.9,63.32) v1(26.48,47.61) v1(26.51,46.63) v1(26.51,45.79) v1(26.96,21.48) v1(27.12,65.37) v1(27.11,64.3) v1(27.12,63.39) v1(27.8,47.62) v1(27.95,46.55) v1(27.95,45.71) v1(28.18,65.37) v1(28.18,64.3) v1(28.2,63.39) v1(28.94,47.62) v1(29.02,46.63) v1(29.02,45.64) v1(29.55,34.89) v1(30.47,84.65) v1(30.62,15.16) v1(31,19.43) v1(31.38,10.28) v1(33.52,9.82) v1(34.51,28.42) v1(38.43,86.61) v1(38.43,85.6) v1(38.43,84.58) v1(39.83,86.6) v1(40.07,85.57) v1(40.07,84.58) v1(40.37,31.69) v1(40.83,69.64) v1(41.53,84.6) v1(41.67,18.28) v1(42.45,58) v1(42.66,13.48) v1(43.42,32.53) v1(43.65,17.29) v1(43.73,18.66) v1(48.38,66.67) v1(49.98,20.87) v1(50.36,11.42) v1(52.03,20.87) v1(52.19,19.58) v1(53.63,17.83) v1(54.04,20.87) v1(54.17,37.79) v1(54.09,19.58) v1(54.55,63.93) v1(54.64,65.84) v1(54.61,64.89) v1(55.77,65.83) v1(55.72,64.89) v1(55.77,64) v1(56.22,35.43) v1(56.22,34.21) v1(56.3,33.37) v1(56.91,65.83) v1(56.93,64.89) v1(56.99,63.93) v1(57.75,35.43) v1(57.75,34.28) v1(57.75,33.37) v1(58.13,65.75) v1(58.21,64.89) v1(58.28,63.93) v1(58.89,82.52) v1(58.89,35.35) v1(58.96,34.26) v1(58.97,33.37) v1(60.44,35.29) v1(60.44,34.26) v1(60.49,33.37) v1(61.79,61.72) v1(61.94,54.78) v1(62.5,38.93) v1(64.53,16.99) v1(65.29,13.29) v1(65.6,85.8) v1(68.95,74.36) v1(69.03,73.55) v1(69.03,72.54) v1(70.17,74.36) v1(70.17,72.54) v1(70.19,73.55) v1(71.01,24.84) v1(71.08,23.77) v1(71.08,22.85) v1(71.43,74.36) v1(71.45,73.55) v1(71.49,72.54) v1(72.07,38.93) v1(72.15,61.18) v1(72.45,54.17) v1(72.45,24.76) v1(72.45,23.77) v1(72.55,74.36) v1(72.55,73.55) v1(72.53,22.85) v1(72.63,72.54) v1(73.83,23.69) v1(73.85,22.85) v1(73.9,24.68) v1(74,49.73) v1(73.98,48.38) v1(73.98,47.24) v1(73.98,46.02) v1(74.97,24.68) v1(75.04,23.62) v1(75.04,22.78) v1(75.12,49.68) v1(75.12,48.38) v1(75.12,47.16) v1(75.12,46.09) v1(76.26,49.75) v1(76.26,48.46) v1(76.26,47.16) v1(76.19,46.02) v1(84.49,40.53)
VBAT: length 15.7
  Top Layer w0.889: U5.5 36.29,26.74 U11.1 Q1.3
  Bottom Layer w0.381: R29.2 34.48,25.45 U11.1
VCC-3.3V: length 543.2
  Top Layer w0.254: v1(53.56,13.02) 52.25,13.02 R6.1 ; C7.2 50.51,24.01 v1(50.51,25.06)
  Top Layer w0.508: 36.73,90.4 36.73,93.3 35.58,94.45 U10.3
  Top Layer w0.762: R69.2 R67.2 R68.2 ; C13.2 C14.2 10.59,66.87 U6.8 ; U2.2 2.78,38.85 3.23,38.4 C2.2 C1.2 3.23,35.27 ; R49.2 R50.2
  Top Layer w0.889: L1.2 57.02,23.48 C5.2 C6.2 C7.2 43.55,29.9
  Top Layer w1.016: 65.14,27.09 65.33,66.2 60.63,70.9 60.58,70.85 C26.2 ; 65.14,27.09 65.14,21.71 68.34,18.51 76.14,18.51 78.33,20.7 78.33,24.6 80.95,27.22 C30.2 80.95,52.34 77.53,55.76 77.53,75.26 73.39,79.4 R16.2 6.93,79.4 6.83,79.5 ; 65.14,27.09 63.43,28.8 ; C32.2 39.38,52.64 U7.1 ; R57.2 44.02,70.77 41.8,73 38.9,70.1 31.75,70.1 ; H1.1 2.03,70.75 2.77,70.75 R27.2 9.61,68.02 10.23,67.4 C14.2 C13.2 16.33,67.4 19.03,70.1 31.75,70.1 ; 28.23,7.3 19.03,7.3 18.43,7.9 18.43,13.89 16.42,15.9 ; R42.2 33.48,86.75 36.77,90.04 44.32,90.04 U9.1 47.68,93.4 50.13,93.4 51.14,92.38 54.84,92.38 66.93,80.3 66.93,79.8 C21.2 ; 16.93,67.7 16.93,62.3 16.48,61.85 R2.2 ; 16.42,15.9 16.39,15.87 C22.2 9.19,15.87 R19.2 8.19,15.81 6.53,17.48 6.53,25.9 4.53,27.9 2.53,27.9 1.77,28.65 R1.2 1.77,33.81 3.23,35.27 ; 16.42,15.9 16.63,15.9 18.13,17.4 18.13,23.85 22.21,27.93 28.95,27.93 31.03,30 31.13,29.9 54.43,29.9 55.51,28.81 R59.2 56.67,28.9 63.13,28.9 ; 31.75,70.1 31.75,56.27 R71.2
  Bottom Layer w0.254: v1(50.51,25.06) 51.19,25.75 60.34,25.75 62.85,23.24 62.85,15.49 60.46,13.1 53.63,13.1 v1(53.56,13.02)
VCC-5V: length 25.4
  Top Layer w0.254: R32.1 46.62,17.82
  Top Layer w0.889: D1.1 44.91,23.46 ; 44.91,23.46 44.91,19.62 44.87,19.58 46.82,17.63 U4.4 ; 44.91,23.46 44.91,24.72 Q1.2
VIN: length 33.6
  Top Layer w0.254: 36.3,11.02 35.93,11.4 31.53,11.4 29.13,13.8 29.13,16.85
  Top Layer w0.889: D5.1 39.51,10.02 36.28,10.02 36.28,11 36.3,11.02 C11.2 36.3,15.08 U5.4 41.68,20.48 Q1.1
ALS_C: length 83.1
  Top Layer w0.254: v1(45.03,88.1) C16.2 48.67,88.1 R31.2 48.73,90.85 U9.2 ; U2.6 7.86,40.61 12.53,45.28 v1(12.53,55.3)
  Bottom Layer w0.254: v1(45.03,88.1) 43.23,89.9 37.23,89.9 36.13,91 34.37,91 33.63,90.25 33.63,90 11.63,68 11.63,59.8 10.63,58.8 10.63,57.1 12.53,55.2 v1(12.53,55.3)
BLUE1: length 200.8
  Top Layer w0.381: v1(27.63,31.6) 34.83,31.6 v1(38.23,35) ; LED5.1 12.48,27.06 15.63,30.2 v1(15.63,31.6) ; LED3.1 74.43,27.09 71.23,30.3 v1(70.33,30.3) ; v1(25.63,77.3) 19.03,77.3 15.03,73.3 10.19,73.3 9.13,72.24 LED6.1 ; v1(33.83,77.3) v1(66.01,77.3) ; v1(66.93,30.4) 66.93,67.3 69.03,69.4 v1(69.03,69.6) 69.18,69.75 LED4.1 ; v1(38.23,35) 38.23,37 Q2.3 ; v1(38.23,35) v1(44.1,35) ; v1(45.81,35) v1(50.17,35)
  Bottom Layer w0.381: v1(44.1,35) v1(45.81,35) ; v1(27.63,31.6) v1(15.63,31.6) ; v1(50.17,35) 51.43,35 56.03,30.4 v1(66.93,30.4) 70.23,30.4 v1(70.33,30.3) ; v1(25.63,77.3) v1(33.83,77.3) ; v1(66.01,77.3) 74.13,77.3 76.03,75.4 76.03,70.9 73.53,68.4 70.23,68.4 v1(69.03,69.6)
BLUE2: length 103.7
  Top Layer w0.381: LED11.1 60.13,37.11 v1(60.13,41.5) ; LED10.1 54.94,59.22 v1(54.93,59.2) 44.43,59.2 ; 44.43,59.2 42.23,61.4 v1(33.13,61.4) ; 44.43,59.2 45.47,58.15 Q7.3 44.63,56.65 v1(44.63,55.7) ; LED9.1 v1(25.33,37.2) ; v1(29.83,61.4) 29.83,59.5 29.13,58.8 27,58.8 24.64,61.16 LED8.1
  Bottom Layer w0.381: v1(25.33,37.2) 31.03,37.2 34.63,40.8 34.63,52.6 36.93,54.9 43.83,54.9 v1(44.63,55.7) ; v1(33.13,61.4) v1(29.83,61.4) ; v1(54.93,59.2) 56.83,57.3 56.83,43 57.73,42.1 59.53,42.1 v1(60.13,41.5)
BLUE3: length 143.2
  Top Layer w0.254: v1(41.73,89) 41.73,88.1 LED13.1 ; v1(53.63,56.4) 53.64,56.4 Q10.3
  Top Layer w0.381: v1(63.33,49.5) 61.08,49.5 55.07,55.52 Q10.3 54.41,55.4 53.13,55.4 48.83,51.1 v1(48.83,49.1) ; LED14.1 24.88,43.61 26.29,42.2 v1(41.93,42.2) ; LED16.1 71.06,49.46 v1(71.03,49.5) ; LED15.1 v1(24.6,18.3)
  Bottom Layer w0.254: v1(41.73,89) 53.37,77.35 53.37,56.65 v1(53.63,56.4)
  Bottom Layer w0.381: v1(48.83,49.1) 48.83,49 42.03,42.2 ; 42.03,42.2 47.63,36.6 47.63,31.1 34.83,18.3 v1(24.6,18.3) ; 42.03,42.2 v1(41.93,42.2) ; v1(71.03,49.5) v1(63.33,49.5)
BLUE_CON1: length 19.3
  Top Layer w0.254: U2.17 19.65,44.04 25.1,38.6 33.59,38.6 34.18,38.01 35.88,38.01 Q2.1
BLUE_CON2: length 33.7
  Top Layer w0.254: v1(22.93,49.9) 20.88,47.85 U2.20 ; v1(30.83,53.7) 44.62,53.7 Q7.1 47.6,56.42 R48.2
  Bottom Layer w0.254: v1(30.83,53.7) 26.73,53.7 v1(22.93,49.9)
BLUE_CON3: length 55.1
  Top Layer w0.254: v1(8.93,38) 8.93,39.54 9.13,39.74 ; Q10.1 53.58,51.71 R66.2 53.77,50.14 45.13,41.5 v1(26.03,41.5)
  Bottom Layer w0.254: v1(8.93,38) 12.43,41.5 v1(26.03,41.5)
CHRG: length 48.1
  Top Layer w0.254: R86.1 v1(31.53,28.5) ; v1(31.33,49.7) 35.63,49.7 v1(35.73,49.6) ; v1(20.43,53) 19.36,53 U2.24
  Bottom Layer w0.254: v1(35.73,49.6) 35.73,40.4 31.53,36.2 v1(31.53,28.5) ; v1(31.33,49.7) 24.23,49.7 22.83,48.3 20.93,48.3 20.43,48.8 v1(20.43,53)
GREEN1: length 191.3
  Top Layer w0.381: v1(27.93,30.8) 49.53,30.8 v1(51.13,32.4) 51.13,36.7 Q4.3 ; v1(35.43,75.8) v1(66.83,75.8) ; v1(23.93,75.7) 19.23,75.7 15.23,71.7 LED6.5 ; LED3.5 71.23,27.39 70.23,28.4 69.05,28.4 ; v1(13.43,30.7) 9.28,26.56 LED5.5 ; 69.05,28.4 69.03,28.42 69.03,66.6 72.38,69.95 LED4.5 72.43,71.2 v1(72.43,70.1) ; 69.05,28.4 v1(69.03,28.4)
  Bottom Layer w0.381: v1(13.43,30.7) 13.53,30.8 v1(27.93,30.8) ; v1(23.93,75.7) 35.33,75.7 v1(35.43,75.8) ; v1(72.43,70.1) 73.23,70.1 74.73,71.6 74.73,74.5 73.43,75.8 v1(66.83,75.8) ; v1(51.13,32.4) 55.13,28.4 v1(69.03,28.4)
GREEN2: length 95.1
  Top Layer w0.381: v1(22.23,37.3) 22.13,37.21 LED9.5 ; v1(58.23,43.2) 58.31,43.2 58.31,39.33 56.58,37.61 LED11.5 ; v1(54.13,57.3) 51.05,57.3 v1(50.55,56.8) ; v1(27.83,60.8) 27.84,60.82 LED8.5 ; LED10.5 58.14,60.48 v1(58.23,60.4) ; v1(33.03,58.3) 33.03,57.69 33.22,57.49 33.41,57.31 Q5.3
  Bottom Layer w0.381: v1(33.03,58.3) 34.53,56.8 v1(50.55,56.8) ; v1(33.03,58.3) 33.03,42.6 29.03,38.6 23.33,38.6 22.03,37.3 v1(22.23,37.3) ; v1(33.03,58.3) 29.13,58.3 27.83,59.6 v1(27.83,60.8) ; v1(54.13,57.3) 54.13,59.8 54.73,60.4 v1(58.23,60.4) v1(58.23,43.2)
GREEN3: length 149.5
  Top Layer w0.254: v1(46.93,44.4) 46.93,44.5 v1(51.93,49.5) ; LED13.5 v1(38.43,89)
  Top Layer w0.381: v1(71.03,46.4) 72.67,46.4 LED16.5 ; LED14.5 28.13,44.4 v1(46.93,44.4) ; v1(63.43,46.5) 61.14,44.22 Q8.3 54.24,44.45 v1(53.03,44.45) ; 21.4,15.28 v1(21.4,16.9)
  Bottom Layer w0.254: v1(51.93,49.5) 51.93,75.5 v1(38.43,89)
  Bottom Layer w0.381: v1(71.03,46.4) 63.53,46.4 v1(63.43,46.5) ; v1(53.03,44.45) 52.98,44.4 v1(46.93,44.4) 49.33,42 49.33,30 36.23,16.9 v1(21.4,16.9)
GREEN_CON1: length 33.9
  Top Layer w0.254: U2.19 19.65,46.58 26.82,39.42 46.88,39.42 R26.2 48.04,38.25 Q4.1
GREEN_CON2: length 20.5
  Top Layer w0.254: v1(21.63,51.1) 20.92,50.39 U2.22 ; R46.2 35.54,56.47 Q5.1 34.06,55 v1(32.13,55)
  Bottom Layer w0.254: v1(21.63,51.1) 25.53,55 v1(32.13,55)
GREEN_CON3: length 47.4
  Top Layer w0.254: U2.9 11.83,39.58 v1(11.83,37.8) ; R64.2 53.53,40.66 Q8.1 51.41,40.1 v1(27.63,40.1)
  Bottom Layer w0.254: v1(11.83,37.8) 14.13,40.1 v1(27.63,40.1)
I2S_SCK: length 7.7
  Top Layer w0.254: R35.2 12.58,62.84 7.86,58.11 U2.35
I2S_SD: length 11.7
  Top Layer w0.254: U2.33 10.4,58.11 14.25,61.97 R28.2 R37.2
I2S_WS: length 7.9
  Top Layer w0.254: v1(8.73,59.9) 8.73,59.94 R36.2 ; 9.13,57.24 9.53,57.64 9.53,58.8 v1(9.73,59)
  Bottom Layer w0.254: v1(8.73,59.9) 8.83,59.9 v1(9.73,59)
INFOR_B: length 75.4
  Top Layer w0.254: v1(26.03,84.9) 30.03,80.9 v1(35.83,80.9) ; R83.2 28.83,91.22 v1(28.83,88.3) ; v1(21.73,52.3) 21.09,51.66 U2.23
  Bottom Layer w0.254: v1(26.03,84.9) 26.03,85.6 28.73,88.3 v1(28.83,88.3) ; v1(35.83,80.9) 40.13,80.9 44.53,76.5 44.53,71.8 40.13,67.4 23.96,67.4 22.63,66.07 22.63,53.2 v1(21.73,52.3)
INFOR_G: length 43.6
  Top Layer w0.254: v1(33.53,88.3) 33.53,88.49 R84.2 ; U2.31 12.93,57.25 v1(12.93,58.5)
  Bottom Layer w0.254: v1(33.53,88.3) 33.53,86.4 13.37,66.24 13.37,58.94 v1(12.93,58.5)
INFOR_R: length 44.1
  Top Layer w0.254: R82.1 34.38,90.1 v1(34.33,90.1) ; v1(11.73,58.5) 11.73,57.3 U2.32
  Bottom Layer w0.254: v1(11.73,58.5) 12.33,59.1 12.33,68.1 v1(34.33,90.1)
IO0: length 8.6
  Top Layer w0.254: C4.2 20.02,60.91 17.98,60.91 ; U2.27 17.98,57.27 17.98,60.91 ; 17.98,60.91 17.98,63.61 17.84,63.75
IO1: length 43.8
  Top Layer w0.254: SW4.2 23.67,86 R42.1 ; v1(2.73,58.6) 2.73,57.29 U2.39
  Bottom Layer w0.254: SW4.2 14.71,86 4.23,75.52 4.23,60.1 v1(2.73,58.6)
IO2: length 52.6
  Top Layer w0.254: v1(4.03,58.6) 4.03,57.26 4.05,57.24
  Bottom Layer w0.254: SW5.1 36.88,94.05 5.13,62.3 5.13,59.7 v1(4.03,58.6)
IO4: length 36
  Top Layer w0.254: v1(5.43,37.6) 5.32,37.71 U2.4
  Bottom Layer w0.254: v1(5.43,37.6) 5.43,36.3 12.83,28.9 28.64,28.9 28.9,28.65 28.93,26.5
  Bottom Layer w0.381: R29.1 28.93,25.56 C15.2
  Bottom Layer w0.635: R29.1 28.87,25.39 R30.2
IO5: length 32.8
  Top Layer w0.254: R38.1 34.18,45.1 v1(30.23,45.1) ; v1(6.53,38) 6.53,39.68 U2.5
  Bottom Layer w0.381: v1(6.53,38) 10.67,42.15 27.27,42.15 v1(30.23,45.1)
IO8: length 41.2
  Top Layer w0.254: v1(15.53,55.3) 15.53,39.79 U2.12 ; R39.2 24.95,71.7 v1(24.33,71.7)
  Bottom Layer w0.254: v1(15.53,55.3) 15.33,55.5 15.33,63.2 23.83,71.7 v1(24.33,71.7)
IO10: length 26.7
  Top Layer w0.254: U2.18 19.65,45.31 26.01,38.96 40.42,38.96 R25.2 42.8,38.05 Q3.1
IO13: length 27.2
  Top Layer w0.254: 43.31,56.63 43.24,56.55 Q6.1 39.27,54.4 v1(31.63,54.4) ; v1(22.13,50) 21.25,49.12 U2.21
  Bottom Layer w0.254: v1(31.63,54.4) 26.43,54.4 22.13,50.1 v1(22.13,50)
IO15: length 50.1
  Top Layer w0.254: 53.48,46.01 53.48,45.73 48.55,40.8 v1(26.73,40.8) ; 53.48,46.01 R65.2 ; 53.48,46.01 Q9.1 ; U2.8 10.43,39.71 v1(10.43,37.9)
  Bottom Layer w0.254: v1(26.73,40.8) 13.33,40.8 v1(10.43,37.9)
IO17: length 43.9
  Top Layer w0.254: R40.2 26.72,76.59 v1(24.43,74.3) ; v1(13.53,55.4) 13.53,41.3 12.94,40.71 U2.10
  Bottom Layer w0.254: v1(13.53,55.4) 13.73,55.6 13.73,63.6 v1(24.43,74.3)
IO18: length 44.5
  Top Layer w0.254: v1(14.63,55.4) 14.63,41.3 14.21,40.88 U2.11 ; R41.2 27.43,78.2 23.73,74.5 23.73,72.5 v1(23.33,72.1)
  Bottom Layer w0.254: v1(14.63,55.4) 14.63,63.4 v1(23.33,72.1)
IO19: length 56.5
  Top Layer w0.254: v1(19.43,26.6) 16.75,29.28 U2.13 ; U3.A7 40.78,8.05 40.63,8.2 39.93,8.2 39.78,8.04 U3.B7 39.78,5.1 38.88,4.2 32.33,4.2 31.93,4.6 D3.1 31.68,7.95 27.63,12 27.63,17.4 23.07,21.95 23.07,22.31 23.52,22.75 23.52,23.11 22.8,23.83 22.44,23.83 22,23.39 21.64,23.39 20.53,24.5 v1(20.53,24.6)
  Bottom Layer w0.254: v1(19.43,26.6) 19.43,25.7 v1(20.53,24.6)
IO20: length 56.5
  Top Layer w0.254: v1(18.83,28.1) 18.02,28.91 U2.14 ; 41.13,6.3 41.13,5 39.71,3.58 31.41,3.58 31.13,3.3 ; 41.13,6.3 40.35,6.3 40.23,6.42 40.23,7.15 U3.A6 ; 41.13,6.3 41.28,6.45 U3.B6 ; D2.2 30.98,7.85 27.13,11.7 27.13,17 v1(20.73,23.4)
  Bottom Layer w0.254: v1(18.83,28.1) 18.83,25.3 v1(20.73,23.4)
IO48: length 51.6
  Top Layer w0.254: R87.1 32.93,25.1 v1(32.93,28.4) ; v1(20.93,54.1) 19.4,54.1 U2.25 ; v1(36.63,51.1) v1(31.23,51.1)
  Bottom Layer w0.254: v1(31.23,51.1) 25.03,51.1 22.63,48.7 21.28,48.7 21.03,48.95 21.03,54 v1(20.93,54.1) ; v1(32.93,28.4) 32.93,36.6 36.63,40.3 v1(36.63,51.1)
RED1: length 194.7
  Top Layer w0.381: v1(24.63,76.5) 19.23,76.5 15.42,72.69 11.18,72.69 10.73,72.24 LED6.3 ; 44.93,34.1 v1(38.63,34.1) ; 44.93,34.1 44.92,34.11 Q3.3 ; 44.93,34.1 v1(50.37,34.1) ; LED3.3 72.83,26.79 v1(70.13,29.5) ; LED5.3 10.88,26.76 v1(13.83,29.7) ; v1(36.34,34.1) 32.43,34.1 v1(30.63,32.3) ; v1(34.63,76.6) v1(66.35,76.6) ; v1(67.83,29.5) 67.87,29.55 67.87,67.05 v1(70.73,69.9) 70.78,69.95 LED4.3
  Bottom Layer w0.381: v1(34.63,76.6) 34.53,76.5 v1(24.63,76.5) ; v1(70.73,69.9) 71.43,69.2 73.43,69.2 75.33,71.1 75.33,74.9 73.63,76.6 v1(66.35,76.6) ; v1(70.13,29.5) v1(67.83,29.5) 55.53,29.5 50.93,34.1 v1(50.37,34.1) ; v1(30.63,32.3) 28.13,29.8 13.93,29.8 v1(13.83,29.7) ; v1(38.63,34.1) v1(36.34,34.1)
RED2: length 96.6
  Top Layer w0.381: LED9.3 v1(23.73,37.4) ; Q6.3 37.02,59.9 v1(33.13,59.9) ; Q6.3 39.33,57.41 v1(39.33,55.6) ; Q6.3 39.42,58.04 41.38,60 v1(42.33,60) ; v1(59.13,43.2) 59.13,38.55 58.18,37.61 LED11.3 ; v1(50.53,58.2) 54.83,58.2 56.54,56.49 ; v1(28.83,59.9) 27.43,59.9 26.24,61.08 LED8.3 ; 56.54,56.49 LED10.3 ; 56.54,56.49 56.54,55.48 59.03,53 v1(59.03,52.9)
  Bottom Layer w0.381: v1(23.73,37.4) 23.63,37.4 24.13,37.9 30.43,37.9 33.83,41.3 33.83,53.6 35.83,55.6 v1(39.33,55.6) ; v1(59.03,52.9) 59.03,43.3 v1(59.13,43.2) ; v1(28.83,59.9) v1(33.13,59.9) ; v1(50.53,58.2) 44.13,58.2 v1(42.33,60)
RED3: length 145.1
  Top Layer w0.254: LED13.3 v1(40.03,89)
  Top Layer w0.381: v1(44.13,43.2) 27.43,43.2 26.48,44.15 LED14.3 ; v1(71.13,48) 72.67,48 LED16.3 ; v1(63.43,47.86) 63.43,47.8 56.58,47.8 54.97,49.42 Q9.3 54.34,49.42 v1(53.43,48.5) ; LED15.3 v1(23,17.6)
  Bottom Layer w0.254: v1(40.03,89) 52.63,76.4 52.63,49.3 v1(53.43,48.5)
  Bottom Layer w0.381: v1(53.43,48.5) 49.43,48.5 v1(44.13,43.2) 48.53,38.8 48.53,30.6 35.53,17.6 v1(23,17.6) ; v1(63.43,47.86) 63.56,48 v1(71.13,48)
RXD0: length 10.9
  Top Layer w0.254: H1.2 4.03,64.27 4.03,60.8 6.59,58.24 U2.36
TXD0: length 7.9
  Top Layer w0.254: H1.3 3.63,62.13 3.63,60.6 5.32,58.91 U2.37
$1N1581: length 11.9
  Top Layer w0.254: 4.05,39.74 4.05,38.86 4.73,38.18 4.73,33.35 C3.2 R1.1 3.28,30.66 SW1.2
$1N2497: length 6.7
  Top Layer w0.254: U3.A5 39.28,5.95 38.33,5 34.58,5 34.33,4.75
$1N2508: length 6.2
  Top Layer w0.254: U3.B5 42.28,5.75 43.28,4.75 R3.2
$1N3854: length 3.1
  Top Layer w0.889: 57.52,18.92 56.23,17.63 U4.3
$1N3890: length 3.3
  Top Layer w0.254: R5.2 R6.2 52.33,14.61 U4.5
$1N5011: length 2.2
  Top Layer w0.254: R7.2 33.75,13.26 U5.2
$1N7236: length 1.7
  Top Layer w0.635: LED3.2 R12.1
$1N7239: length 1.8
  Top Layer w0.635: R14.1 72.83,19.9 LED3.4
$1N7242: length 1.8
  Top Layer w0.635: LED3.6 71.23,19.9 R13.1
$1N7496: length 2.1
  Top Layer w0.635: LED4.2 69.18,77.9 R15.1
$1N7498: length 2.1
  Top Layer w0.635: LED4.4 R17.1
$1N7500: length 2.1
  Top Layer w0.635: LED4.6 72.38,77.82 R16.1
$1N7689: length 1.9
  Top Layer w0.635: R18.1 12.48,17.43 LED5.2
$1N7691: length 1.9
  Top Layer w0.635: R20.1 10.88,17.38 LED5.4
$1N7693: length 2
  Top Layer w0.635: LED5.6 9.13,19.12 R19.1
$1N7882: length 2
  Top Layer w0.635: 9.23,78.24 9.23,76.4 LED6.2
$1N7884: length 1.9
  Top Layer w0.635: 10.88,78.17 10.73,78.02 LED6.4
$1N7886: length 1.9
  Top Layer w0.635: R22.1 12.48,76.45 LED6.6
$1N8648: length 5.6
  Top Layer w0.254: U6.4 7.31,63.9 5.03,63.9 4.53,64.4 4.53,65.53 R27.1
$1N15540: length 23.3
  Top Layer w0.254: SW3.3 52.63,7.16 50.28,7.16 47.33,10.1 47.33,15.79 48.07,16.53 53.33,16.53 54.13,15.73 U4.1
$1N17583: length 9.3
  Top Layer w0.254: R32.2 49.98,6.55 52.34,6.55 52.78,6.11 SW3.2
$1N22825: length 3
  Top Layer w0.254: R35.1 11.07,63.65 9.86,64.87 U6.6
$1N22877: length 1.9
  Top Layer w0.254: U6.3 5.79,64.87 R36.1
$1N23012: length 1.9
  Top Layer w0.254: R37.1 10.79,65.87 U6.7
$1N23226: length 5.3
  Top Layer w0.254: U7.2 35.98,46.95 R38.2
$1N23307: length 2.5
  Top Layer w0.254: 31.64,73 31.64,73.19 30.03,74.8
$1N23351: length 6.1
  Top Layer w0.254: 34.18,73 30.58,76.59 R40.1
$1N23395: length 9.4
  Top Layer w0.254: R41.1 31.51,78.2 36.72,73
$1N26207: length 2.1
  Top Layer w0.635: R50.1 27.93,66.69 LED8.6
$1N26208: length 2.1
  Top Layer w0.635: LED8.4 26.24,68.56 R49.1
$1N26209: length 2
  Top Layer w0.635: LED8.2 R51.1
$1N26222: length 2.1
  Top Layer w0.635: LED9.6 22.13,29.51 R53.1
$1N26223: length 2.1
  Top Layer w0.635: R52.1 23.73,29.51 LED9.4
$1N26224: length 2
  Top Layer w0.635: LED9.2 25.33,29.7 25.5,29.53
$1N26231: length 2.1
  Top Layer w0.635: LED10.6 58.14,69.06 R56.1
$1N26232: length 2.1
  Top Layer w0.635: LED10.4 56.54,69.23 R55.1
$1N26233: length 2.1
  Top Layer w0.635: 54.79,69.27 54.94,69.12 LED10.2
$1N26246: length 1.9
  Top Layer w0.635: LED11.6 56.58,30.47 56.43,30.32
$1N26247: length 1.8
  Top Layer w0.635: R58.1 58.18,30.34 LED11.4
$1N26248: length 1.5
  Top Layer w0.635: LED11.2 59.78,30.62
$1N65495: length 2.3
  Top Layer w0.635: R68.1 38.33,83.3 LED13.6
$1N65496: length 2.3
  Top Layer w0.635: LED13.4 40.05,83.38 40.05,81.11
$1N65497: length 2.3
  Top Layer w0.635: LED13.2 41.73,83.3 R69.1
$1N65505: length 2.1
  Top Layer w0.635: R71.1 28.08,51.1 LED14.6
$1N65506: length 2.1
  Top Layer w0.635: LED14.4 26.48,51.1 R70.1
$1N65507: length 2.1
  Top Layer w0.635: LED14.2 24.88,51.09 R72.1
$1N65514: length 1.7
  Top Layer w0.635: 21.4,10.68 21.4,9.23 R74.1
$1N65515: length 1.6
  Top Layer w0.635: R73.1 23,9.13 LED15.4
$1N65516: length 1.7
  Top Layer w0.635: LED15.2 24.6,9.15 R75.1
$1N65524: length 2.1
  Top Layer w0.635: LED16.6 79.45,46.26 R77.1
$1N65525: length 2.1
  Top Layer w0.635: R76.1 79.43,47.86 LED16.4
$1N65526: length 2.1
  Top Layer w0.635: R78.1 79.45,49.46 LED16.2
$1N67187: length 2.1
  Top Layer w0.254: U10.1 34.73,93.75 R82.2
$1N67189: length 2.3
  Top Layer w0.254: U10.2 31.91,93.75 R84.1
$1N67191: length 4.6
  Top Layer w0.254: U10.4 31.28,94.45 29.57,92.75 R83.1
$1N67359: length 3.2
  Top Layer w0.254: SW5.2 42.03,93.3 R85.1
$1N68623: length 3.3
  Top Layer w0.254: U5.7 33.75,21.38 31.88,23.25 R86.2
$1N68667: length 2.9
  Top Layer w0.254: U5.6 35.02,21.5 R87.2
$1N73747: length 4.8
  Top Layer w0.254: 29.13,18.35 29.13,18.8 31.42,21.09 U5.8
$1N77958: length 10.4
  Top Layer w0.508: U3.B4A9 42.93,8.79 ; U3.A4B9 38.13,8.76
  Top Layer w0.889: D5.2 44.4,10.27 42.93,8.79 42.81,8.91 38.28,8.91 38.13,8.76

## Copper pours and planes (outline as drawn; the poured copper is in the pictures)
GND on Top Layer: outline of 232 points within -11.41,-3.43 92.09,100.07
GND on Bottom Layer: outline of 232 points within -14.15,-6.79 95.23,102.6

Small or netless copper shapes (teardrops, artwork), in the pictures only: 462 on Top Layer, 148 on Bottom Layer

## Text on the board
Bottom Silkscreen Layer: <VBAT
Document Layer: 无VIN | 有VIN
Top Silkscreen Layer: SD^ | VCC | RX | TX | GND | SCK^ | OX | LD | PIR> | <ALS | SW> | RST | BOOT
